# EasyEDA Pro project ProPrj_STM32_无人机_2026-08-31.epro, board PCB1
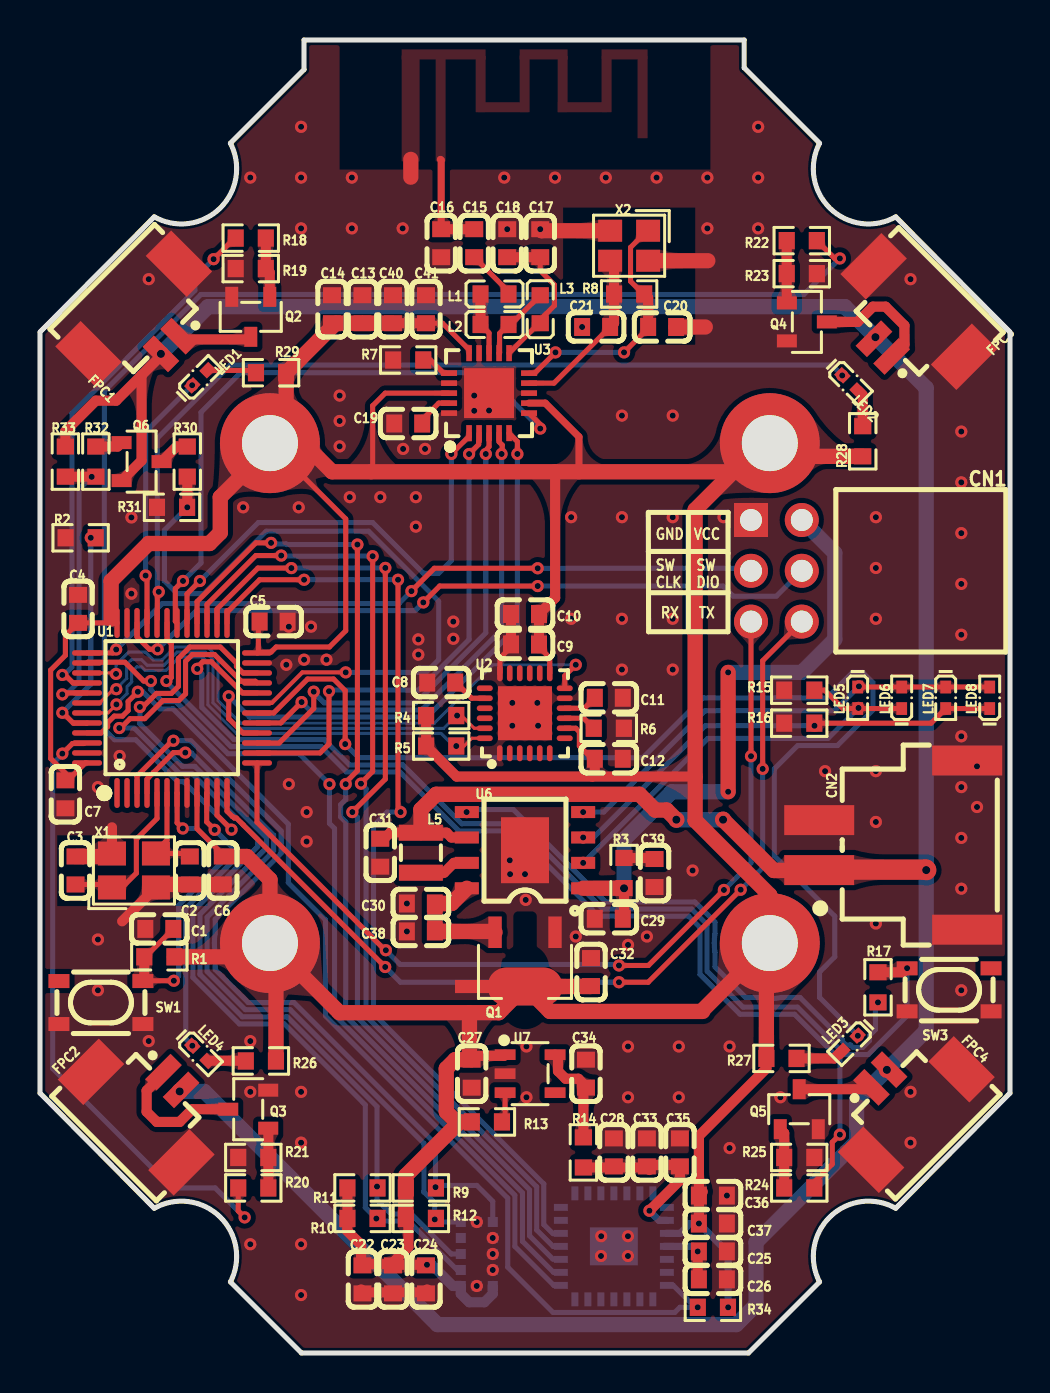
[diagram p14: board, top side]
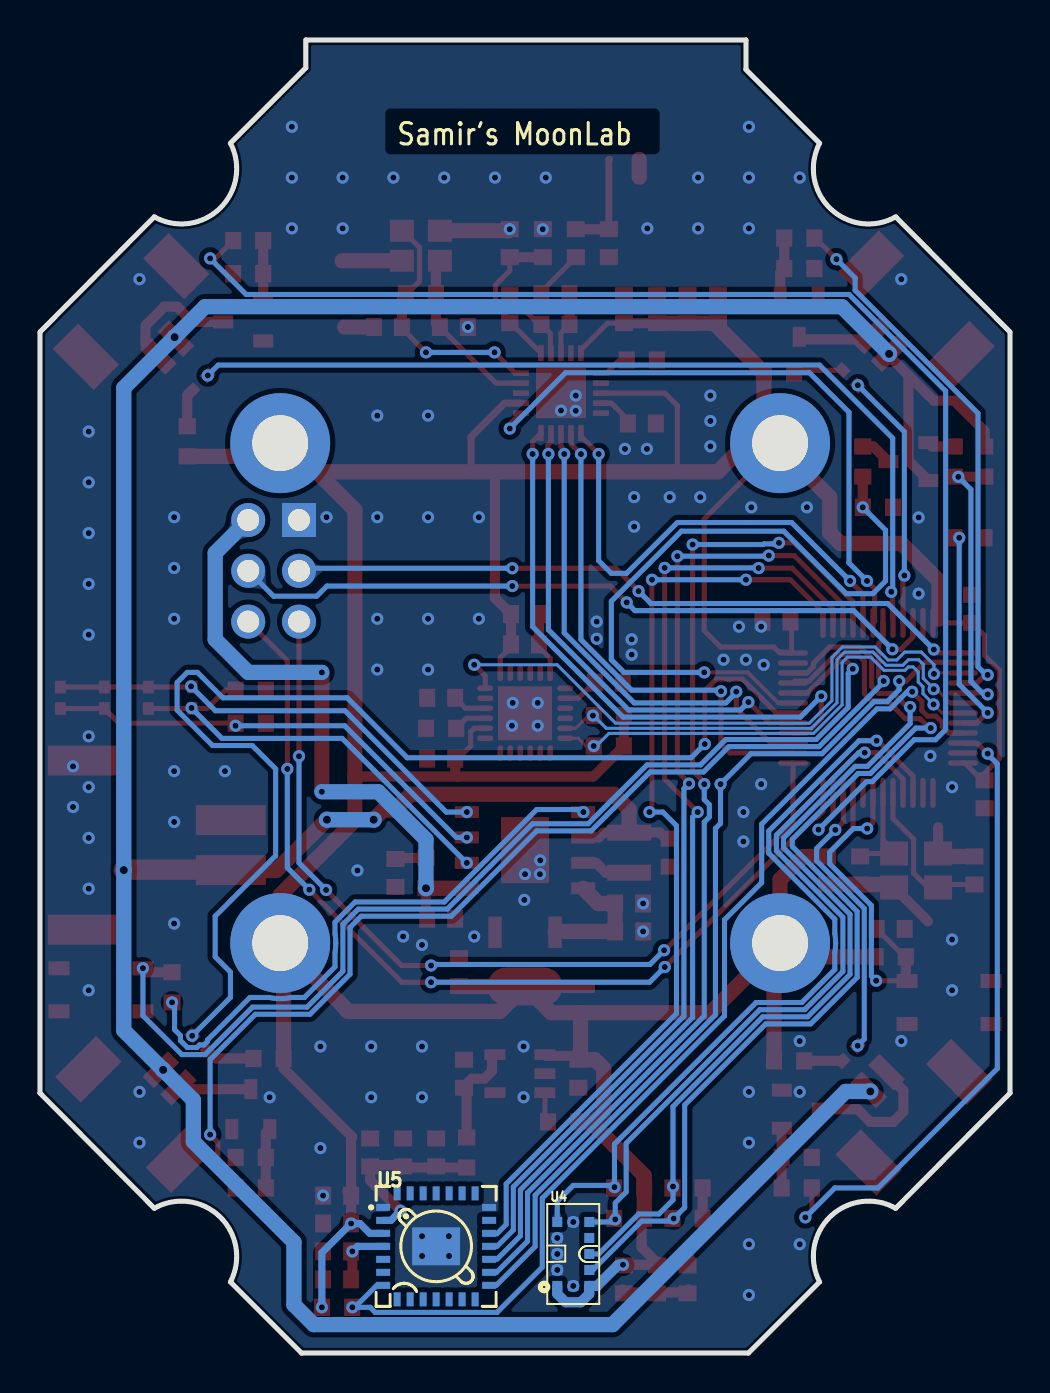
[diagram p15: board, bottom side, seen from below]

Outline 48.51 x 65.66 mm; copper layers: Top Layer, Bottom Layer. Coordinates in mm from the lower left corner of the outline.
Outline path: 0,51.05 5.72,56.81 arc(8.99,57.24) 9.53,60.5 13.21,64.18 13.21,65.66 35.22,65.66 35.22,64.27 38.99,60.5 arc(39.52,57.24) 42.8,56.81 48.51,51.05 ; 0,51 0,13 5.72,7.24 arc(8.99,6.82) 9.53,3.56 13.08,0 35.43,0 38.99,3.56 arc(39.52,6.82) 42.8,7.24 48.51,13 48.51,51
Stack: Top Layer 0.035mm / Dielectric1 1.51mm FR4 er 4.5 / Bottom Layer 0.035mm

## Design rules (mm)
spacing copperThickness1oz (default): track to track 0.102, other pairs 0.152 to 0.3
spacing copperThickness2oz: track to track 0.203, other pairs 0.152 to 0.3
track width copperThickness1oz (default): min 0.127, default 0.254, max 2.54
track width copperThickness2oz: min 0.203, default 0.254, max 2.54
differential pair differentialPair (default): width min 0.127, default 0.254, max 2.54; gap min 0.152, default 0.152
net GND uses copperRegion

## Placement (name value [footprint] x y rotation side)
C1  100nF  [C0603]  5.97 21.21 0 top
C2  12pF  [C0603]  7.49 24.13 90 top
C3  12pF  [C0603]  1.78 24.13 90 top
C4  100nF  [C0603]  1.91 37.21 270 top
C5  100nF  [C0603]  11.68 36.57 180 top
C6  100nF  [C0603]  9.14 24.13 90 top
C7  100nF  [C0603]  1.27 27.94 90 top
C8  2.2nF  [C0603]  20.07 33.53 180 top
C9  100nF  [C0603]  24.26 35.43 180 top
C10  2.2uF  [C0603]  24.26 36.96 180 top
C11  100nF  [C0603]  28.45 32.77 180 top
C12  10nF  [C0603]  28.45 29.72 0 top
C13  100nF  [C0603]  16.13 52.2 270 top
C14  10uF  [C0603]  14.6 52.2 270 top
C15  1.5pF  [C0603]  21.72 55.5 90 top
C16  1pF  [C0603]  20.07 55.5 90 top
C17  4.7pF  [C0603]  25.02 55.5 270 top
C18  2.2nF  [C0603]  23.37 55.5 270 top
C19  33nF  [C0603]  18.41 46.48 180 top
C20  22pF  [C0603]  31.12 51.31 0 top
C21  22pF  [C0603]  27.81 51.31 0 top
C22  4.7uF  [C0603]  16.13 3.68 90 top
C23  100nF  [C0603]  17.65 3.68 90 top
C24  1pF  [C0603]  19.3 3.68 90 top
C25  100nF  [C0603]  33.66 5.08 180 top
C26  4.7uF  [C0603]  33.66 3.68 180 top
C27  1uF  [C0603]  21.59 13.97 90 top
C28  22uF  [C0603]  28.7 10.03 90 top
C29  10uF  [C0603]  28.45 21.72 0 top
C30  10uF  [C0603]  19.05 22.48 180 top
C31  10uF  [C0603]  17.02 25.02 270 top
C32  10uF  [C0603]  27.56 19.05 90 top
C33  22uF  [C0603]  30.35 10.03 90 top
C34  1uF  [C0603]  27.31 13.97 270 top
C35  100nF  [C0603]  32 10.03 90 top
C36  10uF  [C0603]  33.66 7.87 0 top
C37  100nF  [C0603]  33.66 6.48 180 top
C38  22uF  [C0603]  19.05 21.08 0 top
C39  10uF  [C0603]  30.73 24 90 top
C40  10nF  [C0603]  17.65 52.2 270 top
C41  1nF  [C0603]  19.3 52.2 270 top
CN1  IPCP254F06PB28R  [HDR-TH_6P-P2.54-H-F-R2-C3-S2.54-1]  36.83 39.11 90 top
CN2  ZX-XH2.54-2PWT  [CONN-SMD_2P-P2.54_MEGASTAR_ZX-XH2.54-2PWT]  42.67 25.4 90 top
FPC1  1.25-2PWB  [CONN-SMD_2P-P1.25_DEALON_1.25-2PWB]  5.59 51.31 225 top
FPC2  1.25-2PWB  [CONN-SMD_2P-P1.25_DEALON_1.25-2PWB]  5.72 12.7 315 top
FPC3  1.25-2PWB  [CONN-SMD_2P-P1.25_DEALON_1.25-2PWB]  43.05 51.18 135 top
FPC4  1.25-2PWB  [CONN-SMD_2P-P1.25_DEALON_1.25-2PWB]  42.93 12.83 45 top
L1  3.9nH  [L0603]  22.73 52.96 0 top
L2  8.2nH  [L0603]  22.73 51.43 180 top
L3  2.7nH  [L0603]  25.02 52.2 90 top
L5  2.2uH  [IND-SMD_L2.5-W2.0_MHCHL2520]  19.05 25.02 90 top
LED1  XL-1005UYC  [LED0402-FD_YELLOW]  8 48.77 225 top
LED2  XL-1005UYC  [LED0402-FD_YELLOW]  40.51 48.51 135 top
LED3  XL-1005UYC  [LED0402-FD_YELLOW]  40.51 15.49 45 top
LED4  XL-1005UYC  [LED0402-FD_YELLOW]  8 14.98 135 top
LED5  XL-1005UYC  [LED0402-FD_YELLOW]  40.89 32.77 90 top
LED6  XL-1005UYC  [LED0402-FD_YELLOW]  43.1 32.77 270 top
LED7  XL-1005UYC  [LED0402-FD_YELLOW]  45.3 32.77 90 top
LED8  XL-1005UYC  [LED0402-FD_YELLOW]  47.5 32.77 270 top
NOREF  -  [Pad_e328]  36.5 20.5 0 top
NOREF#2  -  [Pad_e1132]  20.03 59.69 90 top
NOREF#3  -  [Pad_e327]  36.5 45.5 0 top
NOREF#4  -  [Pad_e326]  11.5 45.5 0 top
NOREF#5  -  [Pad_e1131]  18.54 59.69 90 top
NOREF#6  -  [Pad_e325]  11.5 20.5 0 top
Q1  AMS1117-3.3V  [SOT-89-3_L4.5-W2.5-P1.50-LS4.2-BR]  24.26 19.68 90 top
Q2  AO3400A  [SOT-23-3_L2.9-W1.3-P1.90-LS2.4-BR]  10.54 51.81 90 top
Q3  AO3400A  [SOT-23-3_L2.9-W1.3-P1.90-LS2.4-BR]  10.41 12.19 0 top
Q4  AO3400A  [SOT-23-3_L2.9-W1.3-P1.90-LS2.4-BR]  38.35 51.56 180 top
Q5  AO3400A  [SOT-23-3_L2.9-W1.3-P1.90-LS2.4-BR]  37.97 12.19 270 top
Q6  SI2301A  [SOT-23-3_L2.9-W1.3-P1.90-LS2.4-BR]  5.08 44.58 180 top
R1  10KΩ  [R0603]  5.97 19.81 0 top
R2  10KΩ  [R0603]  2.03 40.77 180 top
R3  2Ω  [R0603]  29.21 24 90 top
R4  10KΩ  [R0603]  20.07 31.88 180 top
R5  10KΩ  [R0603]  20.07 30.35 180 top
R6  10KΩ  [R0603]  28.45 31.24 180 top
R7  22KΩ  [R0603]  18.41 49.66 180 top
R8  1MΩ  [R0603]  29.46 52.96 180 top
R9  10K  [R0603]  19.05 8.25 0 top
R10  10K  [R0603]  16.13 6.73 0 top
R11  10K  [R0603]  16.13 8.25 0 top
R12  10K  [R0603]  19.05 6.73 0 top
R13  1KΩ  [R0603]  22.35 11.56 0 top
R14  3Ω  [R0603]  27.18 10.03 270 top
R15  100KΩ  [R0603]  37.97 33.15 0 top
R16  100KΩ  [R0603]  37.97 31.49 0 top
R17  10KΩ  [R0603]  41.91 18.29 90 top
R18  1KΩ  [R0603]  10.54 55.75 0 top
R19  10KΩ  [R0603]  10.54 54.23 0 top
R20  1KΩ  [R0603]  10.67 8.25 0 top
R21  10KΩ  [R0603]  10.67 9.78 0 top
R22  1KΩ  [R0603]  38.1 55.62 180 top
R23  10KΩ  [R0603]  38.1 53.97 180 top
R24  1KΩ  [R0603]  37.97 8.25 180 top
R25  10KΩ  [R0603]  37.97 9.78 180 top
R26  10K  [R0603]  11.05 14.6 0 top
R27  10K  [R0603]  37.08 14.73 180 top
R28  10K  [R0603]  41.15 45.59 270 top
R29  10K  [R0603]  11.56 49.02 0 top
R30  100KΩ  [R0603]  7.37 44.58 90 top
R31  100KΩ  [R0603]  6.6 42.29 0 top
R32  1KΩ  [R0603]  2.79 44.58 270 top
R33  100KΩ  [R0603]  1.27 44.58 270 top
R34  10K  [R0603]  33.66 2.28 180 top
SW1  SKRPACE010  [KEY-SMD_4P-L4.2-W3.2-P2.20-LS4.6]  3.05 17.52 0 top
SW3  SKRPACE010  [KEY-SMD_4P-L4.2-W3.2-P2.20-LS4.6]  45.47 18.16 0 top
U1  STM32F103C8T6  [LQFP-48_L7.0-W7.0-P0.50-LS9.0-BL]  6.6 32.26 0 top
U2  MPU-6050  [QFN-24_L4.0-W4.0-P0.50-BL-EP2.7]  24.24 31.99 0 top
U3  Si24R1  [QFN-20_L4.0-W4.0-P0.50-BL-EP]  22.46 48 0 top
U4  VL53L1CXV0FY/1  [OPTO-SMD_VL53L1CXV0FY-1]  21.84 4.95 270 bottom
U5  PMW3901MB-TXQT  [COB-28_L6.0-W6.0-P0.65-TL-EP]  28.7 5.33 180 bottom
U6  IP5305T  [ESOP-8_L4.9-W3.9-P1.27-LS6.0-BL-EP]  24.26 25.14 90 top
U7  XC6204B182MR  [SOT-23-5_L3.0-W1.5-P0.95-LS2.8-BL]  24.51 13.97 270 top
X1  8MHz  [CRYSTAL-SMD_4P-L3.2-W2.5-BL]  4.7 24.13 0 top
X2  16MHz  [CRYSTAL-SMD_4P-L2.5-W2.0-BL-2]  29.46 55.37 180 top

## Footprints (pads in the part's own frame, mm; a bottom-side part is the same pattern mirrored in y, then rotated)
C0603
  rect 0.8x0.9 smd: 1(-0.7,0) 2(0.7,0)
COB-28_L6.0-W6.0-P0.65-TL-EP
  rect 0.7x0.35 smd: 1(-2.65,1.95) 2(-2.65,1.3) 3(-2.65,0.65) 4(-2.65,0) 5(-2.65,-0.65) 6(-2.65,-1.3) 7(-2.65,-1.95) 15(2.65,-1.95) 16(2.65,-1.3) 17(2.65,-0.65) 18(2.65,0) 19(2.65,0.65) 20(2.65,1.3) 21(2.65,1.95)
  rect 0.35x0.7 smd: 8(-1.95,-2.65) 9(-1.3,-2.65) 10(-0.65,-2.65) 11(0,-2.65) 12(0.65,-2.65) 13(1.3,-2.65) 14(1.95,-2.65) 22(1.95,2.65) 23(1.3,2.65) 24(0.65,2.65) 25(0,2.65) 26(-0.65,2.65) 27(-1.3,2.65) 28(-1.95,2.65)
  rect 2.4x1.9 smd: 29(0,0)
CONN-SMD_2P-P1.25_DEALON_1.25-2PWB
  rect 0.8x1.8 smd: 1(-0.625,1.275) 2(0.625,1.275)
  rect 1.8x2.9 smd: 3(-3.2,-1.275) 4(3.2,-1.275)
CONN-SMD_2P-P2.54_MEGASTAR_ZX-XH2.54-2PWT
  rect 1.5x3.5 smd: 1(-1.25,3.7) 2(1.25,3.7) 3(-4.23,-3.7) 4(4.23,-3.7)
CRYSTAL-SMD_4P-L2.5-W2.0-BL-2
  rect 1.2x1.1 smd: 1(-0.95,-0.75) 2(0.95,-0.75) 3(0.95,0.75) 4(-0.95,0.75)
CRYSTAL-SMD_4P-L3.2-W2.5-BL
  rect 1.4x1.2 smd: 1(-1.1,-0.85) 2(1.1,-0.85) 3(1.1,0.85) 4(-1.1,0.85)
ESOP-8_L4.9-W3.9-P1.27-LS6.0-BL-EP
  rect 0.6x1.2 smd: 1(-1.905,-2.909) 2(-0.635,-2.909) 3(0.635,-2.909) 4(1.905,-2.909) 5(1.905,2.909) 6(0.635,2.909) 7(-0.635,2.909) 8(-1.905,2.909)
  rect 3.3x2.4 smd: 9(0,0)
HDR-TH_6P-P2.54-H-F-R2-C3-S2.54-1
  rect 1.7x1.7 hole 1.1: 1(2.54,1.27)
  round 1.7 hole 1.1: 2(2.54,-1.27) 3(0,1.27) 4(0,-1.27) 5(-2.54,1.27) 6(-2.54,-1.27)
IND-SMD_L2.5-W2.0_MHCHL2520
  rect 0.8x2.2 smd: 1(-1,0) 2(1,0)
KEY-SMD_4P-L4.2-W3.2-P2.20-LS4.6
  rect 1.05x0.7 smd: 1(-2.1,1.075) 2(2.1,1.075) 3(-2.1,-1.075) 4(2.1,-1.075)
L0603
  rect 0.8x0.864 smd: 1(-0.7,0) 2(0.7,0)
LED0402-FD_YELLOW
  rect 0.636x0.54 smd: 1(-0.538,0) 2(0.538,0)
LQFP-48_L7.0-W7.0-P0.50-LS9.0-BL
  oval 0.27x1.5 smd: 1(-2.75,-4.25) 2(-2.25,-4.25) 3(-1.75,-4.25) 4(-1.25,-4.25) 5(-0.75,-4.25) 6(-0.25,-4.25) 7(0.25,-4.25) 8(0.75,-4.25) 9(1.25,-4.25) 10(1.75,-4.25) 11(2.25,-4.25) 12(2.75,-4.25) 25(2.75,4.25) 26(2.25,4.25) 27(1.75,4.25) 28(1.25,4.25) 29(0.75,4.25) 30(0.25,4.25) 31(-0.25,4.25) 32(-0.75,4.25) 33(-1.25,4.25) 34(-1.75,4.25) 35(-2.25,4.25) 36(-2.75,4.25)
  oval 1.5x0.27 smd: 13(4.25,-2.75) 14(4.25,-2.25) 15(4.25,-1.75) 16(4.25,-1.25) 17(4.25,-0.75) 18(4.25,-0.25) 19(4.25,0.25) 20(4.25,0.75) 21(4.25,1.25) 22(4.25,1.75) 23(4.25,2.25) 24(4.25,2.75) 37(-4.25,2.75) 38(-4.25,2.25) 39(-4.25,1.75) 40(-4.25,1.25) 41(-4.25,0.75) 42(-4.25,0.25) 43(-4.25,-0.25) 44(-4.25,-0.75) 45(-4.25,-1.25) 46(-4.25,-1.75) 47(-4.25,-2.25) 48(-4.25,-2.75)
OPTO-SMD_VL53L1CXV0FY-1
  rect 0.5x0.5 smd: 1(1.6,-0.8) 2(0.8,-0.8) 3(0,-0.8) 4(-0.8,-0.8) 5(-1.6,-0.8) 6(-1.6,0) 7(-1.6,0.8) 8(-0.8,0.8) 9(0,0.8) 10(0.8,0.8) 11(1.6,0.8) 12(1.6,0)
Pad_e325
  round 5 hole 2.8: 1(0,0)
Pad_e326
  round 5 hole 2.8: 1(0,0)
Pad_e327
  round 5 hole 2.8: 1(0,0)
Pad_e328
  round 5 hole 2.8: 1(0,0)
Pad_e1131
  rect 0.2x0.2 smd: 2(0,0)
Pad_e1132
  rect 0.2x0.2 smd: 1(0,0)
QFN-20_L4.0-W4.0-P0.50-BL-EP
  rect 0.28x0.8 smd: 1(-1,-2) 2(-0.5,-2) 3(0,-2) 4(0.5,-2) 5(1,-2) 11(1,2) 12(0.5,2) 13(0,2) 14(-0.5,2) 15(-1,2)
  rect 0.8x0.28 smd: 6(2,-1) 7(2,-0.5) 8(2,0) 9(2,0.5) 10(2,1) 16(-2,1) 17(-2,0.5) 18(-2,0) 19(-2,-0.5) 20(-2,-1)
  rect 2.5x2.5 smd: 21(0,0)
QFN-24_L4.0-W4.0-P0.50-BL-EP2.7
  oval 0.28x0.8 smd: 1(-1.25,-2) 2(-0.75,-2) 3(-0.25,-2) 4(0.25,-2) 5(0.75,-2) 6(1.25,-2) 13(1.25,2) 14(0.75,2) 15(0.25,2) 16(-0.25,2) 17(-0.75,2) 18(-1.242,2)
  oval 0.8x0.28 smd: 7(2,-1.25) 8(2,-0.75) 9(2,-0.25) 10(2,0.25) 11(2,0.75) 12(2,1.25) 19(-2,1.25) 20(-2,0.75) 21(-2,0.25) 22(-2,-0.25) 23(-2,-0.75) 24(-2,-1.25)
  rect 2.7x2.7 smd: 25(0.013,0)
R0603
  rect 0.806x0.864 smd: 1(-0.753,0) 2(0.753,0)
SOT-23-3_L2.9-W1.3-P1.90-LS2.4-BR
  rect 1x0.65 smd: 1(1,-0.95) 2(1,0.95) 3(-1,0)
SOT-23-5_L3.0-W1.5-P0.95-LS2.8-BL
  rect 0.532x1.045 smd: 1(-0.95,-1.25) 2(0,-1.25) 3(0.95,-1.25) 4(0.95,1.25) 5(-0.95,1.25)
SOT-89-3_L4.5-W2.5-P1.50-LS4.2-BR
  rect 1.575x0.672 smd: 1(1.356,-1.5) 3(1.356,1.5)
  custom 1.9x5.377 smd: 2(-1.356,0)

## Nets
As in the schematic, except:
3V3: C4.2 C5.2 C6.2 C7.2 C9.1 C10.1 C12.1 C13.2 C14.2 C22.2 C23.2 C24.2 C27.2 C32.1 C36.1 C37.2 C40.2 C41.2 NOREF.1 NOREF#3.1 NOREF#4.1 NOREF#6.1 Q1.2 R1.2 R4.2 R5.2 R9.1 R10.1 R11.1 R12.1 R13.1 R26.2 R27.2 R28.2 R29.2 R34.1 U1.9 U1.24 U1.36 U1.48 U2.8 U2.13 U3.7 U3.15 U3.18 U4.1 U4.11 U5.3 U7.1
GND: C1.1 C2.1 C3.2 C4.1 C5.1 C6.1 C7.1 C8.2 C9.2 C10.2 C11.1 C12.2 C13.1 C14.1 C16.1 C17.1 C18.1 C19.2 C20.2 C21.1 C22.1 C23.1 C24.1 C25.1 C26.1 C27.1 C28.2 C29.1 C30.2 C31.2 C32.2 C33.2 C34.1 C35.2 C36.2 C37.1 C38.1 C39.1 C40.1 C41.1 CN1.1 CN2.2 CN2.3 CN2.4 FPC1.3 FPC1.4 FPC2.3 FPC2.4 FPC3.3 FPC3.4 FPC4.3 FPC4.4 NOREF#5.2 Q1.1 Q2.2 Q3.2 Q4.2 Q5.2 R2.2 R6.1 R7.2 R15.1 R16.1 R19.1 R21.1 R23.1 R25.1 R31.1 SW1.3 SW1.4 SW3.3 SW3.4 U1.8 U1.23 U1.35 U1.47 U2.1 U2.11 U2.18 U2.25 U3.8 U3.14 U3.17 U3.20 U3.21 U4.2 U4.3 U4.4 U4.6 U4.12 U5.1 U5.21 U5.29 U6.9 U7.2 X1.2 X1.4 X2.2 X2.4
AT1: C15.2 C16.2 NOREF#2.1

Pads without a net: SW1 1; SW3 2; U1 1 2; U2 2 3 4 5 6 7 14 15 16 17 19 21 22; U4 8; U5 5 6 8 9 10 11 12 13 14 20 22 23 24 25 26 27 28; U7 4

## Via types
v1: diameter 0.61, hole 0.305, Top Layer to Bottom Layer, 225 vias
v2: diameter 0.813, hole 0.406, Top Layer to Bottom Layer, 8 vias

## Routing (per net, layer and track width the routed paths; a pad name or vN(x,y) marks a point on that pad's centre or on a via; arc(x,y) is an arc through that point)
1V8: length 5.2
  Top Layer w0.508: R14.1 27.18,13.14 C34.2 27.31,13.33 26.92,13.71 26.29,13.71 25.91,14.1 25.91,14.77 U7.5
3V3: length 258.7
  Top Layer w0.254: U2.8 26.8,31.24 26.98,31.06 26.98,30.35 27.61,29.72 C12.1 ; C41.2 20.13,51.5 21.46,50.17 U3.15 ; 1.33,28.58 2.27,29.51 U1.48 ; 10.92,35.05 11.56,35.05 11.81,35.3 14.48,35.3 15.29,36.12 15.29,41.71 NOREF#4.1 ; 10.92,35.05 10.88,35.01 U1.24 ; 10.92,35.05 10.92,36.51 ; C7.2 1.27,28.99 0.53,29.73 0.53,34.15 1.27,34.89 1.27,35.88 C4.2 3.75,36.51 3.75,36.51 U1.36 ; U2.13 25.49,34.77 24.96,35.3 ; U3.18 17.27,48 16.64,47.37 16.64,44.14 16.57,44.07 ; 9.08,24.83 9.08,24.99 7.85,26.22 U1.9
  Top Layer w0.355: U3.7 25.27,47.5 26.96,45.81 26.96,44.07
  Top Layer w0.508: 18.42,7.11 18.42,5.29 17.71,4.58 ; C36.1 33.15,8.06 ; C36.1 v1(32.96,6.48) ; C36.1 32.96,10.86 ; 32.89,10.79 32.96,10.86 ; 32.96,10.86 36.33,14.23 R27.2 ; C41.2 C40.2 ; U7.1 23.2,14.86 21.78,14.86 C27.2 ; 15.37,6.61 15.37,6.1 16.06,5.41 16.06,4.44 17.58,4.44 17.71,4.58 ; 17.71,4.58 17.88,4.41 v1(19.35,4.41) ; 32.77,28.83 27.62,28.83 ; 27.62,28.83 20.84,28.83 R5.2 R4.2 ; 27.62,28.83 27.75,28.95 C12.1 ; 25.76,44.07 25.76,37.76 C10.1 24.96,35.3 ; R11.1 R10.1
  Top Layer w0.762: C6.2 10.35,24.83 11.5,23.68 NOREF#6.1 10.81,19.81 R1.2 ; R27.2 36.33,20.33 33.15,17.14 ; 21.48,17.02 14.98,17.02 11.8,20.2 R26.2 ; 21.48,17.02 21.48,14.78 C27.2 20.77,14.67 20.32,14.22 20.32,12.06 20.83,11.56 20.98,11.56 ; 21.48,17.02 22.95,17.02 24.26,18.33 ; 24.26,18.33 25.5,17.08 33.15,17.08 ; 24.26,18.33 27.54,18.33 C32.1 ; 20.98,11.56 R13.1 ; 20.98,11.56 18.3,8.87 R9.1 18.3,7.11 ; R28.2 37.16,44.84 NOREF#3.1 ; NOREF#4.1 11.5,45.28 9.02,42.8 9.02,41.02 8.48,40.48 5.43,40.48 3.56,38.61 3.56,36.7 ; NOREF#4.1 13.17,45.5 14.6,44.07 34.67,44.07 32.77,42.16 32.77,26.63 36.5,22.89 NOREF.1 ; NOREF#4.1 12.31,46.31 R29.2 12.32,49.02 14.79,51.5 C13.2 C40.2
  Bottom Layer w0.355: v1(34.42,2.28) 34.42,5.01 v1(32.96,6.48) 32.51,6.48 32.02,5.98 U5.3
  Bottom Layer w0.508: U4.1 22.64,2.96 22.22,2.54 21.46,2.54 21.04,2.96 U4.11 20.65,3.35 19.59,4.41 v1(19.35,4.41)
+5V: length 6.3
  Top Layer w0.762: Q1.3 22.72,21.08 C38.2 C30.1 20.59,22.48 U6.8
GND: length 24.1
  Top Layer w0.254: 23.56,35.3 23,34.75 U2.18
  Top Layer w0.508: 19.36,3.18 19.21,3.03 16.21,3.03 16.06,3.18 ; 23.56,36.96 23.56,35.3 ; X1.4 3.6,26.29 ; 5.8,23.28 4.11,21.59
  Top Layer w0.762: C20.2 33.27,51.31 ; X2.4 33.4,54.62 ; X2.2 25.1,56.12 v1(25.02,56.2) ; 5.8,23.28 5.95,23.43 C2.1 C6.1 ; NOREF#5.2 18.54,58.8 ; 3.22,24.98 3.07,24.83 C3.2
  vias: v1(2.9,28.3) v1(2.9,20.68) v1(2.9,18.14) v1(3.98,29.85) v1(4.57,41.78) v1(4.57,37.97) v1(5.44,53.7) v1(5.44,15.6) v1(10.16,42.29) v1(10.52,58.78) v1(10.52,15.6) v1(10.52,13.06) v1(10.52,5.44) v1(12.32,34.42) v1(12.45,36.32) v1(12.45,28.45) v1(12.94,42.29) v1(13.06,61.32) v1(13.06,58.78) v1(13.06,56.24) v1(13.06,13.06) v1(13.06,10.52) v1(13.06,5.44) v1(13.06,2.9) v1(13.21,34.67) v1(13.34,27.05) v1(13.34,25.58) v1(13.56,36.32) v1(14.33,34.67) v1(14.99,47.88) v1(14.99,46.61) v1(14.99,45.34) v1(15.49,42.8) v1(15.6,58.78) v1(15.6,56.24) v1(17.02,42.8) v1(18.14,56.24) v1(18.16,45.21) v1(18.35,22.48) v1(18.35,21.08) v1(18.8,42.8) v1(18.8,41.32) v1(18.92,35.69) v1(18.92,34.92) v1(19.26,45.21) v1(20.67,36.57) v1(20.67,35.72) v1(21.72,47.88) v1(21.72,47.12) v1(21.84,6.55) v1(21.84,3.35) v1(22.46,47.13) v1(22.64,5.75) v1(22.64,4.95) v1(22.64,4.15) v1(23.22,58.78) v1(23.37,56.2) v1(23.5,24.64) v1(23.51,23.94) v1(23.62,32.51) v1(23.62,31.37) v1(24.26,23.94) v1(24.29,22.66) v1(24.33,15.33) v1(24.33,12.79) v1(24.87,32.51) v1(24.91,31.37) v1(25.76,58.78) v1(26.56,41.8) v1(26.56,36.72) v1(26.8,20.83) v1(27.11,51.31) v1(28.07,5.84) v1(28.06,4.85) v1(28.3,58.78) v1(29.1,46.88) v1(29.1,41.8) v1(29.1,36.72) v1(29.1,34.18) v1(29.41,20.41) v1(29.41,15.33) v1(29.41,12.79) v1(29.41,5.84) v1(29.41,4.85) v1(30.35,20.83) v1(30.84,58.78) v1(31.65,46.88) v1(31.65,41.8) v1(31.65,36.72) v1(31.65,34.18) v1(31.95,15.33) v1(31.95,12.79) v1(32.64,24.13) v1(33.38,58.78) v1(33.38,56.24) v1(34.19,41.8) v1(34.35,7.87) v1(34.49,15.33) v1(34.49,10.25) v1(35.92,61.32) v1(35.92,58.78) v1(35.92,56.24) v1(37.03,12.79) v1(39.26,29.1) v1(41.81,41.8) v1(41.81,39.26) v1(41.81,36.72) v1(41.81,29.1) v1(41.81,26.56) v1(41.81,21.48) v1(43.54,53.7) v1(43.54,13.06) v1(43.54,10.52) v1(46.08,46.08) v1(46.08,43.54) v1(46.08,41) v1(46.08,38.46) v1(46.08,35.92) v1(46.08,30.84) v1(46.08,28.3) v1(46.08,25.76) v1(46.08,23.22) v1(46.08,18.14) v1(46.86,29.34) v1(46.86,27.3)
VBAT: length 170.2
  Top Layer w0.508: Q6.2 5.08,44.63 5.08,48.89 ; 5.08,48.89 6.05,49.86 v2(6.05,49.96) ; 5.08,48.89 3.81,47.62 2.79,47.62 1.27,46.1 R33.1 ; U6.6 20.57,25.78 20.34,26.02 L5.2 19.03,26.03 17.53,26.03 17.21,25.72 C31.1
  Top Layer w0.762: v2(31.83,26.67) 31.34,27.15 30.77,27.15 29.98,27.94 19.81,27.94 19.05,27.18 L5.2 ; 38.95,24.13 36.7,24.13 v2(34.16,26.67)
  Top Layer w1.016: v2(44.32,24.15) 44.3,24.17 39,24.17 CN2.1
  Bottom Layer w0.762: v2(6.98,13.08) 8.22,13.08 19.88,1.42 34.82,1.42 35.81,2.41 35.81,5.54 40.84,10.57 40.84,12.65 v2(42.35,14.16) 44.32,16.13 v2(44.32,24.15) 44.32,48.26 v2(41.78,50.8) 40.26,52.32 8.41,52.32 v2(6.05,49.96) ; v2(31.83,26.67) v2(34.16,26.67)
VCC: length 30.9
  Top Layer w0.508: 29.02,21.72 29.21,21.91 v2(29.21,23.24)
  Top Layer w0.762: v1(34.42,34.03) v1(34.42,28.07) ; v2(29.21,23.24) U6.1
  Bottom Layer w0.762: v2(29.21,23.24) 29.21,25.68 31.6,28.07 v1(34.42,28.07) ; v1(34.42,34.03) 38.1,34.03 39.75,35.69 39.75,40 CN1.2
AT1: length 5.2
  Top Layer w0.355: NOREF#2.1 20.07,59.65 C16.2
  Top Layer w0.508: C16.2 C15.2
BAT-ADC-EN: length 14.6
  Top Layer w0.254: U1.41 1.19,33.01 v1(1.12,32.93)
  Top Layer w0.508: v1(2.58,43.81) 2.79,43.81 R32.2 R33.2
  Bottom Layer w0.254: v1(2.58,43.81) 1.96,43.19 1.96,33.58 1.31,32.93 v1(1.12,32.93)
BAT_DET: length 35.3
  Top Layer w0.203: 15.34,34.03 13.12,34.03 11.59,32.51 U1.19
  Top Layer w0.254: v1(7.37,42.29) R31.2
  Top Layer w0.508: R30.1 7.37,42.3 R31.2
  Bottom Layer w0.254: 15.34,34.03 19.3,34.03 19.94,34.67 19.94,37.59 16.43,41.1 11.31,41.1 8.19,37.97 6.86,37.97 6.22,38.61 6.22,41.15 v1(7.37,42.29)
  vias: v1(15.29,34.03)
I2C1-SCL: length 25
  Top Layer w0.152: v1(3.82,33.19) 3.67,33.19 2.98,32.51 U1.42 ; 22.24,31.24 21.72,31.24 21.08,31.88 R4.1
  Bottom Layer w0.152: v1(20.86,31.88) 20.83,31.88 20.19,31.24 9.93,31.24 8.65,32.52 8.65,34.67 8.28,35.05 6.86,35.05 6.2,34.39 5.36,34.39 5.08,34.67 4.57,34.67 4.34,34.44 4.34,33.74 3.82,33.22 v1(3.82,33.19)
I2C1-SDA: length 24.9
  Top Layer w0.152: U2.24 21.6,30.74 21.21,30.35 20.69,30.35 ; U1.43 3.4,32.01 v1(3.82,32.43)
  Bottom Layer w0.152: 20.69,30.35 20.06,30.98 9.83,30.98 8.4,32.41 8.4,34.53 8.13,34.8 6.96,34.8 6.3,34.14 5.25,34.14 5.08,34.31 4.84,34.31 4.59,34.05 4.59,33.56 4.35,33.32 4.35,32.97 3.82,32.45 v1(3.82,32.43)
  vias: v1(20.82,30.35)
I2C2-SCL: length 49.9
  Top Layer w0.254: v1(3.97,31.25) 4.03,31.25 4.5,31.72 5.24,31.72 6.14,32.63 6.95,32.63 7.28,32.96 7.28,34.59 7.62,34.92 8.73,34.92 10.06,33.59 10.77,33.59 U1.21
  Bottom Layer w0.254: U4.10 20.87,4.15 18.42,6.6 16.95,6.6 v1(16.82,6.72) 16.27,7.27 16.27,12.4 12.22,16.46 9.97,16.46 7.64,18.78 7.64,22.08 10.89,25.33 10.89,25.69 7.59,28.98 6.98,28.98 4.71,31.25 v1(3.97,31.25)
I2C2-SDA: length 47.9
  Top Layer w0.254: v1(5,32.31) 5.15,32.31 5.83,32.98 6.57,32.98 6.92,33.34 6.92,34.74 7.49,35.3 9.02,35.3 9.82,34.5 9.82,34.34 10.15,34.01 U1.22
  Bottom Layer w0.254: v1(5,32.31) 5,31.47 7.13,29.34 7.74,29.34 11.33,25.75 11.33,25.26 8,21.94 8,18.93 10.12,16.81 12.36,16.81 16.85,12.32 v1(16.85,8.32) 16.85,7.66 17.56,6.95 18.57,6.95 20.57,4.95 U4.9
LED1: length 12.9
  Top Layer w0.254: U1.33 5.35,38.81 v1(5.28,38.88)
  Bottom Layer w0.254: v1(7.61,48.4) 5.28,46.07 v1(5.28,38.88)
LED2: length 45.3
  Top Layer w0.254: 5.87,36.7 5.87,38.03 5.95,38.11
  Bottom Layer w0.254: v1(40.12,48.88) 39.6,49.4 9.53,49.4 5.87,45.74 5.87,37.99 5.94,37.92
  vias: v1(5.94,38.06)
LED3: length 59.9
  Top Layer w0.254: U1.18 11.69,32.01 13.39,33.7 14.68,33.7 15.26,33.12 v1(15.26,30.45)
  Bottom Layer w0.254: v1(15.26,30.45) 15.95,29.77 30.15,29.77 33.15,32.77 39.37,32.77 40.64,34.03 41.15,34.03 41.66,33.53 41.66,32.15 39.88,30.38 37.9,30.38 36.73,29.21 36.73,24.87 39.75,21.84 39.75,19.81 38.99,19.05 38.99,17.78 v1(40.9,15.86)
LED4: length 14.3
  Top Layer w0.254: v1(8.74,26.16) 8.34,26.56 8.34,27.99 U1.10
  Bottom Layer w0.254: v1(7.62,15.37) 7.29,15.7 7.29,22.23 9.67,24.62 9.67,25.22 v1(8.74,26.16)
LEFT-0: length 26.8
  Top Layer w0.254: R18.1 9.74,55.75 v1(8.68,54.7) ; U1.40 1.65,33.51 1.25,33.91 1.2,33.91
  Bottom Layer w0.254: v1(8.68,54.7) 7.75,53.76 7.75,53.14 1.6,46.99 1.6,34.31 1.2,33.91
  vias: v1(1.12,33.91)
LEFT-1: length 31.5
  Top Layer w0.254: 1.15,29.97 1.15,30 1.63,30.48 2.21,30.48 ; R20.1 9.91,7.1 v1(10.24,6.78)
  Bottom Layer w0.254: 1.15,29.97 0.64,29.46 0.64,14.22 6.6,8.25 8.76,8.25 v1(10.24,6.78)
  vias: v1(1.12,29.97)
MPU_INT: length 31.1
  Top Layer w0.152: v1(3.8,33.96) 3.76,34.01 U1.39
  Top Layer w0.254: U2.12 26.24,33.86 v1(26.8,34.42)
  Bottom Layer w0.152: v1(26.8,34.42) 22.65,34.42 19.72,31.49 10.04,31.49 8.91,32.62 8.91,34.78 8.38,35.3 6.75,35.3 6.1,34.66 5.66,34.66 5.27,35.05 4.44,35.05 3.8,34.42 v1(3.8,33.96)
NRST: length 16.5
  Top Layer w0.254: R1.1 5.27,19.81 C1.2 ; U1.7 6.86,28 6.86,26.51 v1(7.14,26.23) ; v1(6.69,18.62) 5.16,18.62
  Top Layer w0.508: SW1.2 5.22,18.67 R1.1
  Bottom Layer w0.254: v1(6.69,18.62) 6.93,18.85 6.93,22.38 9.02,24.46 9.02,25.04 7.83,26.23 v1(7.14,26.23)
OSC_IN: length 7.7
  Top Layer w0.254: C3.1 4.25,23.43 4.82,24 4.82,25.69 5.85,26.73 U1.5
OSC_OUT: length 4.7
  Top Layer w0.254: 7.37,24.83 7.22,24.98 5.92,24.98 5.92,25.22 6.35,25.66 U1.6
PA1: length 68.6
  Top Layer w0.254: U1.11 8.85,26.89 v1(9.58,26.17) ; R22.1 39.74,54.74 v1(40,54.74)
  Bottom Layer w0.254: v1(40,54.74) 38.2,52.93 8.05,52.93 3.22,48.1 3.22,31.17 3.72,30.67 4.79,30.67 6.88,28.57 7.17,28.57 v1(9.58,26.17)
PA2: length 46.7
  Top Layer w0.254: v1(36.14,29.21) 36.14,34.62 CN1.6 ; v1(35.04,23.17) 30.42,18.54 v1(28.96,18.54) ; U1.12 9.35,27.09 9.62,26.83 9.63,26.83 9.71,26.75 9.82,26.75 10.16,26.41 10.16,26.41 v1(17.26,19.3)
  Bottom Layer w0.254: v1(17.26,19.3) 18.03,18.54 v1(28.96,18.54) ; v1(36.14,29.21) 36.14,24.27 v1(35.04,23.17)
PA3: length 44.8
  Top Layer w0.254: v1(34.21,23.16) 30.43,19.38 v1(28.96,19.38) ; v1(17.3,20.14) 17.26,20.14 10.85,26.55 U1.13 ; CN1.5 v1(35.56,29.84)
  Bottom Layer w0.254: v1(28.96,19.38) 28.91,19.43 18.01,19.43 v1(17.3,20.14) ; v1(35.56,29.84) 35.56,24.51 v1(34.21,23.16)
PA4: length 25
  Top Layer w0.254: v1(14.45,33.09) 14.45,30.45 14.01,30.01 U1.14 ; v1(21.46,44.95) 21.94,45.43 21.94,45.55 21.96,45.57 U3.2
  Bottom Layer w0.254: v1(21.46,44.95) 21.46,35.68 18.93,33.15 14.51,33.15 v1(14.45,33.09)
PA5: length 24.5
  Top Layer w0.254: U1.15 10.86,30.5 11.96,30.5 13.69,32.23 v1(13.69,33.07) ; 22.35,45.21 22.46,45.32 U3.3
  Bottom Layer w0.254: v1(13.69,33.07) 13.69,33.03 14.21,32.51 18.79,32.51 22.3,36.01 v1(22.3,44.96)
PA6: length 29.4
  Top Layer w0.254: v1(23.88,44.96) 23.88,45.58 U3.5 ; U1.16 10.15,31.01 9.44,31.72 v1(9.44,32.84)
  Bottom Layer w0.254: v1(9.44,32.84) 10.49,31.8 19.35,31.8 23.88,36.32 v1(23.88,44.96)
PA7: length 24.4
  Top Layer w0.254: U1.17 12.04,31.51 v1(13.08,32.55) ; U3.4 22.96,45.56 23.12,45.4 23.12,44.99 v1(23.09,44.96)
  Bottom Layer w0.254: v1(13.08,32.55) 13.48,32.15 19.07,32.15 23.09,36.17 v1(23.09,44.96)
PA8: length 24.2
  Top Layer w0.254: U3.1 21.46,45.84 v1(20.57,44.96) ; U1.29 7.35,37.96 v1(8,38.61)
  Bottom Layer w0.254: v1(8,38.61) 10.92,41.53 16.64,41.53 19.18,38.99 19.94,38.99 20.57,39.62 v1(20.57,44.96)
PA9: length 31
  Top Layer w0.254: v1(7.15,38.61) 6.77,38.22 6.77,36.59 U1.30 ; U3.6 25.02,46.44 v1(25.02,46.23)
  Bottom Layer w0.254: v1(25.02,46.23) 22.22,49.02 10.03,49.02 8.05,47.04 8.05,39.51 v1(7.15,38.61)
PA10: length 53
  Top Layer w0.254: U1.31 6.35,35.68 6.57,35.47 6.57,33.78 6.39,33.6 v1(6.32,33.6) ; R24.1 38.73,8.55 39.62,9.45 39.62,10.54 v1(40,10.92)
  Bottom Layer w0.254: v1(40,10.92) 40,14.67 37.74,16.94 35.01,16.94 33.01,18.94 33.01,21.28 32.45,21.84 27.94,21.84 23.67,26.11 20.95,26.11 18,29.06 15.33,29.06 14.06,30.32 9.55,30.32 6.32,33.55 v1(6.32,33.6)
PA13: length 36.2
  Top Layer w0.254: v1(19.17,37.53) 19.99,38.35 v1(24.89,38.35) ; U1.34 4.85,35.81 5.47,35.19 v1(5.88,35.19)
  Bottom Layer w0.254: v1(19.17,37.53) 18.76,37.12 7.82,37.12 v1(5.88,35.19) ; CN1.4 36.83,37.84 34.67,37.84 34.16,38.35 v1(24.89,38.35)
PA14: length 35
  Top Layer w0.254: U1.37 3.64,35.01 v1(3.81,35.18) ; v1(18.58,38.1) 19.72,39.24 v1(24.89,39.24)
  Bottom Layer w0.254: v1(24.89,39.24) 35.43,39.24 CN1.3 ; v1(18.58,38.1) 17.96,37.48 6.11,37.48 v1(3.81,35.18)
PA15: length 45
  Top Layer w0.254: U1.38 2.39,34.54 4.25,34.54 5.19,33.6 v1(5.54,33.6)
  Bottom Layer w0.254: v1(5.54,33.6) 5.54,33.17 6.14,32.57 6.8,32.57 9.4,29.97 12.96,29.97 v1(14.48,28.45) 14.48,26.48 14.73,26.23 14.73,16.91 23.75,7.89 23.75,5.33 25.69,3.38 U5.15
PB2: length 54.4
  Top Layer w0.254: U1.20 10.13,33.01 8.57,34.57 8.14,34.57 7.86,34.29 v1(7.86,34.21)
  Top Layer w0.508: R17.2 43.16,19.04 v1(43.37,19.24)
  Bottom Layer w0.254: v1(7.86,34.21) 8.09,33.98 8.09,32.28 9.7,30.68 14.21,30.68 15.48,29.41 18.15,29.41 21.09,26.47 23.88,26.47 28.15,22.2 32.59,22.2 33.37,21.43 33.37,19.09 35.16,17.3 37.89,17.3 40.26,14.92 41.42,14.92 43.37,16.87 v1(43.37,19.24)
PB8: length 53.2
  Top Layer w0.254: U1.45 3.07,31.01 3.38,31.32 3.38,31.52 3.71,31.85 4.13,31.85 4.41,32.13 4.41,32.58 v1(4.89,33.07)
  Bottom Layer w0.254: 32.77,2.28 31.67,3.38 U5.7 ; 32.77,2.28 32,2.28 31.75,2.03 25.65,2.03 23.39,4.29 23.39,7.74 14.28,16.86 14.28,21.66 12.42,23.52 12.42,26.45 6.65,32.21 6,32.21 5.14,33.07 v1(4.89,33.07) ; 32.77,2.28 v1(32.89,2.28)
PB12: length 47.6
  Top Layer w0.254: v1(18.03,27.05) 17.91,27.18 v1(17.91,38.67) ; v1(13.21,38.67) 10.98,38.67 9.35,37.04 U1.25
  Bottom Layer w0.254: 26.05,5.97 25.65,5.97 25.2,6.42 25.2,8.46 16.68,16.97 16.68,26.37 17.36,27.05 v1(18.03,27.05) ; v1(13.21,38.67) v1(17.91,38.67)
PB13: length 49.8
  Top Layer w0.254: v1(15.62,27.05) 17.27,28.7 v1(17.27,39.26) ; v1(12.57,39.25) 10.9,39.25 8.85,37.21 U1.26
  Bottom Layer w0.254: U5.17 26.04,4.7 25.65,4.7 24.49,5.86 24.49,8.16 15.88,16.77 15.88,26.8 v1(15.62,27.05) ; v1(17.27,39.26) 12.58,39.26 v1(12.57,39.25)
PB14: length 49.4
  Top Layer w0.254: v1(16.64,39.84) 16.64,29.08 16.13,28.57 16.13,28.55 v1(16.05,28.47) ; v1(12.06,39.88) 10.79,39.88 8.35,37.44 U1.27
  Bottom Layer w0.254: v1(12.06,39.88) 12.1,39.84 v1(16.64,39.84) ; v1(16.05,28.47) 16.31,28.22 16.31,16.84 24.84,8.31 24.84,6.15 25.66,5.33 U5.18
PB15: length 51.9
  Top Layer w0.254: U1.28 7.85,37.57 10.79,40.51 v1(11.56,40.51) ; v1(15.29,28.45) 15.29,28.54 15.88,29.12 v1(15.88,40.43)
  Bottom Layer w0.254: v1(11.56,40.51) 11.64,40.43 11.79,40.43 11.82,40.46 12.31,40.46 12.34,40.43 v1(15.88,40.43) ; v1(15.29,28.45) 15.29,27.67 15.04,27.42 15.04,26.81 15.29,26.55 15.29,16.85 24.13,8.01 24.13,5.59 25.68,4.03 U5.16
PC14: length 40
  Top Layer w0.254: U1.3 4.85,28.86 6.62,30.62 v1(6.67,30.62)
  Bottom Layer w0.254: U4.5 22.64,7.58 21.84,8.38 19.87,8.38 v1(19.78,8.29) 19.78,10.44 12.7,17.52 10.41,17.52 8.76,19.18 8.76,20.02 arc(8.73,20.26) 8.72,20.5 arc(8.73,20.74) 8.76,20.98 8.76,21.69 12.06,24.99 12.06,26.1 7.55,30.62 v1(6.67,30.62)
PC15: length 37.3
  Top Layer w0.254: U1.4 5.35,28.7 5.44,28.79 5.44,28.79 5.68,29.04 5.69,29.04 6.67,30.02 v1(7.27,30.02)
  Bottom Layer w0.254: v1(7.27,30.02) 7.56,30.02 11.68,25.9 11.68,25.12 8.36,21.79 8.36,19.08 10.27,17.17 12.51,17.17 19.2,10.48 19.2,8.05 19.74,7.51 v1(19.74,6.68) 19.87,6.55 U4.7
XI: length 12.5
  Top Layer w0.254: v1(25.78,50.04) 24.74,49 U3.10 ; R8.1 30.17,52.96 29.53,53.59 29.53,55.29 30.37,56.12 X2.1 ; v1(29.21,50.04) 30.41,51.24
  Top Layer w0.508: R8.1 30.41,52.76 C20.1
  Bottom Layer w0.254: v1(25.78,50.04) v1(29.21,50.04)
XO: length 8.7
  Top Layer w0.254: C21.2 25.71,48.5 U3.9
  Top Layer w0.508: C21.2 28.71,51.5 R8.2 28.71,54.42 X2.3
$1N28: length 10.8
  Top Layer w0.254: v1(1.12,32.02) 1.15,32.02 1.67,31.49 2.34,31.49 U1.44
  Bottom Layer w0.254: v1(2.54,40.77) 2.54,33.44 v1(1.12,32.02)
$1N68: length 2
  Top Layer w0.508: 10.3,14.48 10.16,14.61 8.39,14.61
$1N70: length 2.5
  Top Layer w0.254: 8.39,49.14 10.69,49.14 R29.1
$1N71: length 1.9
  Top Layer w0.508: R28.1 41.15,47.9 40.9,48.14
$1N72: length 2.6
  Top Layer w0.508: 37.71,14.73 39.73,14.73 40.12,15.12
$1N90: length 1.6
  Top Layer w0.508: R30.2 6.83,45.33 Q6.3
$1N91: length 1.4
  Top Layer w0.508: Q6.1 3.88,45.33 R32.1
$2N9: length 1.8
  Top Layer w0.254: C8.1 20.81,33.53 21.59,32.74 U2.20
$2N13: length 1.7
  Top Layer w0.254: U2.10 27.22,32.24 C11.2
$2N14: length 1.7
  Top Layer w0.254: R6.2 27.19,31.74 U2.9
$3N27: length 3.1
  Top Layer w0.254: U3.13 22.46,51.01 22.03,51.43
  Top Layer w0.508: 22.03,52.96 22.03,51.43
$3N28: length 2.6
  Top Layer w0.254: 21.72,54.8 23.43,53.08 L1.2
$3N29: length 3.8
  Top Layer w0.254: U3.12 22.99,50.03 22.99,50.99 L2.1 23.56,51.43 L3.2
$3N30: length 7.7
  Top Layer w0.254: 25.02,54.8 25.02,54.12 25.73,53.41 25.73,52.38 25.02,51.67 L3.1 24.96,51.5 U3.11
  Top Layer w0.508: 23.37,54.8 25.02,54.8
$3N35: length 1.6
  Top Layer w0.254: R7.1 19.53,49.66 20.18,49 U3.16
$3N37: length 1.9
  Top Layer w0.254: U3.19 19.94,47.5 19.12,46.67 19.12,46.48
$5N18: length 23
  Top Layer w0.254: LED8.2 LED7.1 44.56,31.49 R16.2
  Bottom Layer w0.254: v1(27.17,25.78) 27.69,25.78 33.27,31.37 v1(38.74,31.37)
$5N19: length 21.7
  Top Layer w0.254: R15.2 39.24,33.15 40.16,32.23 LED5.1 LED6.2
  Bottom Layer w0.254: v1(40.94,32.26) 39.41,30.73 33.4,30.73 27.18,24.51 v1(27.17,24.51)
$5N20: length 23
  Top Layer w0.254: LED8.1 LED7.2 LED6.1 LED5.2
  Bottom Layer w0.254: v1(27.17,27.05) 28.19,27.05 33.26,32.12 39.74,32.12 v1(40.96,33.34)
$5N26: length 2.5
  Top Layer w0.508: U6.7 20.7,24.51 20.21,24.02 L5.1
$5N28: length 28.7
  Bottom Layer w0.254: v1(41.91,17.53) 41.78,17.41 41.78,16.17 41.49,15.88 41.49,15.62 41.15,15.28 40.66,15.28 40.53,15.41 40.31,15.41 40.13,15.59 40.13,15.66 38.01,17.78 37.07,17.78 arc(36.5,17.72) 35.93,17.78 35.29,17.78 33.76,19.31 33.76,20.04 arc(33.73,20.27) 33.72,20.5 arc(33.73,20.73) 33.76,20.96 33.76,21.55 32.75,22.55 28.29,22.55 23.67,27.18 21.46,27.18 v1(21.34,27.05)
$5N39: length 1.5
  Top Layer w0.254: U7.3 23.26,11.71 R13.2
$5N42: length 1.5
  Top Layer w0.508: R3.2 30.68,24.76 C39.2
$6N2: length 3.5
  Top Layer w0.508: Q2.3 10.41,50.69 7.05,50.69
$6N6: length 3
  Top Layer w0.508: R18.2 R19.2 11.49,54.03 Q2.1
$6N9: length 3
  Top Layer w0.508: Q3.1 11.42,11.23 R21.2 R20.2
$6N11: length 6.9
  Top Layer w0.508: 6.27,14.05 5.33,13.12 5.33,12.06 5.84,11.56 6.98,11.56 7.62,12.19 Q3.3
$6N14: length 3.1
  Top Layer w0.508: R22.2 R23.2 37.35,52.52 Q4.1
$6N16: length 6.6
  Top Layer w0.508: Q4.3 40.89,51.56 41.66,52.32 42.29,52.32 43.24,51.38 43.24,50.43 42.5,49.7
$6N19: length 3
  Top Layer w0.508: Q5.1 37.22,10.99 R25.2 R24.2
$6N21: length 3.5
  Top Layer w0.508: 41.47,13.32 41.34,13.19 Q5.3
$7N7: length 3.3
  Top Layer w0.254: v1(32.89,5.08) 32.9,5.07 32.96,5.07
  Top Layer w0.508: v1(32.89,5.08) 32.89,3.74 C26.2
  Bottom Layer w0.355: v1(32.89,5.08) 32.64,5.33 31.22,5.33
$7N9: length 9
  Top Layer w0.508: v1(30.48,7.11) 32,8.64 C35.1 ; 30.35,9.28 R14.2 ; 30.35,9.28 30.48,9.15 ; 30.35,9.28 30.35,9.4 32,9.4
  Bottom Layer w0.355: v1(30.48,7.11) 30.96,6.63 U5.2

## Copper pours and planes (outline as drawn; the poured copper is in the pictures)
GND on Top Layer: 18.09,64.89 18.99,64.89 18.99,59.59 18.09,59.59
GND on Top Layer: -3.94,69.72 54.48,69.72 54.48,-4.7 -3.94,-4.7
GND on Bottom Layer: -12.7,68.83 62.74,68.83 62.74,-2.54 -12.7,-2.54
AT1 on Top Layer: 29.89,64.87 30.39,64.87 30.39,60.75 29.89,60.75
AT1 on Top Layer: 25.89,64.87 26.39,64.87 26.39,62.05 25.89,62.05
AT1 on Top Layer: 21.88,62.54 24.42,62.54 24.42,62.05 21.88,62.05
AT1 on Top Layer: 23.99,65.19 26.39,65.19 26.39,64.69 23.99,64.69
AT1 on Top Layer: 18.09,65.19 22.29,65.19 22.29,64.69 18.09,64.69
AT1 on Top Layer: 28.09,64.87 28.59,64.87 28.59,62.05 28.09,62.05
AT1 on Top Layer: 28.09,65.19 30.39,65.19 30.39,64.69 28.09,64.69
AT1 on Top Layer: 23.99,64.87 24.49,64.87 24.49,62.05 23.99,62.05
AT1 on Top Layer: 21.79,64.87 22.29,64.87 22.29,62.05 21.79,62.05
AT1 on Top Layer: 25.9,62.55 28.39,62.55 28.39,62.05 25.9,62.05
AT1 on Top Layer: 19.79,64.92 20.29,64.92 20.29,59.59 19.79,59.59

Small or netless copper shapes (teardrops, artwork), in the pictures only: 371 on Top Layer, 121 on Bottom Layer

## Text on the board
Bottom Silkscreen Layer: Samir's MoonLab
Top Silkscreen Layer: GND | SW / CLK | RX | VCC | SW / DIO | TX
